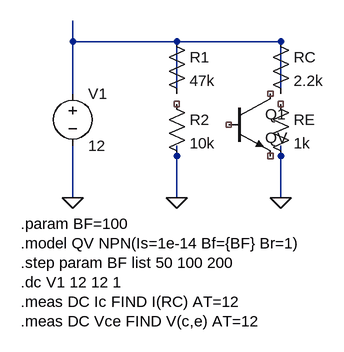
[diagram p0: schematic Ex11.asc]
Ex11.asc, the LTspice schematic file:
Version 4
SHEET 1 1680 1080
WIRE 160 80 160 48
WIRE 160 160 160 80
WIRE 320 80 160 80
WIRE 320 160 320 80
WIRE 480 80 320 80
WIRE 480 160 480 80
WIRE 160 320 160 240
WIRE 320 320 320 240
WIRE 480 320 480 240
FLAG 160 320 0
FLAG 320 320 0
FLAG 480 320 0
SYMBOL voltage 160 144 R0
WINDOW 123 0 0 Left 0
WINDOW 39 0 0 Left 0
SYMATTR InstName V1
SYMATTR Value 12
SYMBOL res 304 64 R0
SYMATTR InstName R1
SYMATTR Value 47k
SYMBOL res 304 160 R0
SYMATTR InstName R2
SYMATTR Value 10k
SYMBOL res 464 64 R0
SYMATTR InstName RC
SYMATTR Value 2.2k
SYMBOL res 464 160 R0
SYMATTR InstName RE
SYMATTR Value 1k
SYMBOL npn 400 160 R0
SYMATTR InstName Q1
SYMATTR Value QV
NET 160 80 vcc
NET 320 80 b
NET 480 80 c
NET 400 208 e
TEXT 80 360 Left 2 !.param BF=100
TEXT 80 390 Left 2 !.model QV NPN(Is=1e-14 Bf={BF} Br=1)
TEXT 80 420 Left 2 !.step param BF list 50 100 200
TEXT 80 450 Left 2 !.dc V1 12 12 1
TEXT 80 480 Left 2 !.meas DC Ic FIND I(RC) AT=12
TEXT 80 510 Left 2 !.meas DC Vce FIND V(c,e) AT=12

The netlist it stands for:
* Ex11.asc
V1 N001 0 12
R1 N001 N001 47k
R2 NC_01 0 10k
RC N001 N001 2.2k
RE NC_02 0 1k
Q1 NC_03 NC_04 NC_05 0 QV
.model NPN NPN
.model PNP PNP
.lib standard.bjt
.param BF=100
.model QV NPN(Is=1e-14 Bf={BF} Br=1)
.step param BF list 50 100 200
.dc V1 12 12 1
.meas DC Ic FIND I(RC) AT=12
.meas DC Vce FIND V(c,e) AT=12
.backanno
.end